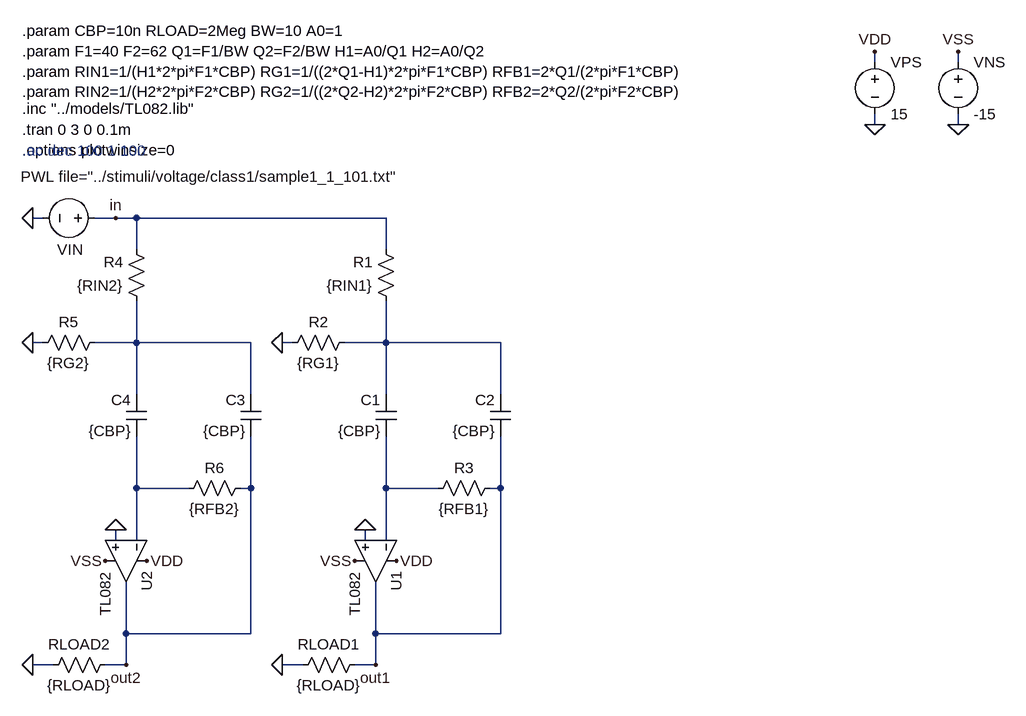
[diagram p0: schematic bpf2.asc]
bpf2.asc, the LTspice schematic file:
Version 4.1
SHEET 1 2028 1860
WIRE 688 -224 688 -240
WIRE 816 -224 816 -240
WIRE 688 -128 688 -144
WIRE 816 -128 816 -144
WIRE -592 16 -608 16
WIRE -480 16 -512 16
WIRE -448 16 -480 16
WIRE -64 16 -448 16
WIRE -448 64 -448 16
WIRE -64 64 -64 16
WIRE -592 208 -608 208
WIRE -448 208 -448 144
WIRE -448 208 -512 208
WIRE -272 208 -448 208
WIRE -208 208 -224 208
WIRE -64 208 -64 144
WIRE -64 208 -128 208
WIRE 112 208 -64 208
WIRE -448 288 -448 208
WIRE -272 288 -272 208
WIRE -64 288 -64 208
WIRE 112 288 112 208
WIRE -448 432 -448 352
WIRE -368 432 -448 432
WIRE -272 432 -272 352
WIRE -272 432 -288 432
WIRE -64 432 -64 352
WIRE 16 432 -64 432
WIRE 112 432 112 352
WIRE 112 432 96 432
WIRE -480 512 -480 496
WIRE -448 512 -448 432
WIRE -96 512 -96 496
WIRE -64 512 -64 432
WIRE -464 656 -464 576
WIRE -272 656 -272 432
WIRE -272 656 -464 656
WIRE -80 656 -80 576
WIRE 112 656 112 432
WIRE 112 656 -80 656
WIRE -576 704 -608 704
WIRE -464 704 -464 656
WIRE -464 704 -496 704
WIRE -192 704 -224 704
WIRE -80 704 -80 656
WIRE -80 704 -112 704
FLAG -608 16 0
FLAG -224 208 0
FLAG -96 496 0
FLAG -224 704 0
FLAG -48 544 VDD
FLAG -112 544 VSS
FLAG -480 16 in
FLAG -80 704 out1
FLAG 688 -128 0
FLAG 816 -128 0
FLAG 688 -240 VDD
FLAG 816 -240 VSS
FLAG -608 208 0
FLAG -480 496 0
FLAG -608 704 0
FLAG -432 544 VDD
FLAG -496 544 VSS
FLAG -464 704 out2
SYMBOL voltage -496 16 R90
WINDOW 123 -36 130 VLeft 2
WINDOW 39 0 0 Left 0
WINDOW 3 -64 130 VLeft 2
WINDOW 0 49 34 VRight 2
SYMATTR Value PWL file="../stimuli/voltage/class1/sample1_1_101.txt"
SYMATTR InstName VIN
SYMBOL res -48 160 R180
WINDOW 0 36 76 Left 2
WINDOW 3 36 40 Left 2
SYMATTR InstName R1
SYMATTR Value {RIN1}
SYMBOL res -112 192 R90
WINDOW 0 0 56 VBottom 2
WINDOW 3 32 56 VTop 2
SYMATTR InstName R2
SYMATTR Value {RG1}
SYMBOL cap 128 352 R180
WINDOW 0 24 56 Left 2
WINDOW 3 24 8 Left 2
SYMATTR InstName C2
SYMATTR Value {CBP}
SYMBOL cap -48 352 R180
WINDOW 0 24 56 Left 2
WINDOW 3 24 8 Left 2
SYMATTR InstName C1
SYMATTR Value {CBP}
SYMBOL res 112 416 R90
WINDOW 0 0 56 VBottom 2
WINDOW 3 32 56 VTop 2
SYMATTR InstName R3
SYMATTR Value {RFB1}
SYMBOL res -96 688 R90
WINDOW 0 0 56 VBottom 2
WINDOW 3 32 56 VTop 2
SYMATTR InstName RLOAD1
SYMATTR Value {RLOAD}
SYMBOL OpAmps\\opamp2 -16 544 R90
SYMATTR InstName U1
SYMATTR Value TL082
SYMBOL voltage 688 -240 R0
WINDOW 123 0 0 Left 0
WINDOW 39 0 0 Left 0
SYMATTR InstName VPS
SYMATTR Value 15
SYMBOL voltage 816 -240 R0
WINDOW 123 0 0 Left 0
WINDOW 39 0 0 Left 0
SYMATTR InstName VNS
SYMATTR Value -15
SYMBOL res -432 160 R180
WINDOW 0 36 76 Left 2
WINDOW 3 36 40 Left 2
SYMATTR InstName R4
SYMATTR Value {RIN2}
SYMBOL res -496 192 R90
WINDOW 0 0 56 VBottom 2
WINDOW 3 32 56 VTop 2
SYMATTR InstName R5
SYMATTR Value {RG2}
SYMBOL cap -256 352 R180
WINDOW 0 24 56 Left 2
WINDOW 3 24 8 Left 2
SYMATTR InstName C3
SYMATTR Value {CBP}
SYMBOL cap -432 352 R180
WINDOW 0 24 56 Left 2
WINDOW 3 24 8 Left 2
SYMATTR InstName C4
SYMATTR Value {CBP}
SYMBOL res -272 416 R90
WINDOW 0 0 56 VBottom 2
WINDOW 3 32 56 VTop 2
SYMATTR InstName R6
SYMATTR Value {RFB2}
SYMBOL res -480 688 R90
WINDOW 0 0 56 VBottom 2
WINDOW 3 32 56 VTop 2
SYMATTR InstName RLOAD2
SYMATTR Value {RLOAD}
SYMBOL OpAmps\\opamp2 -400 544 R90
SYMATTR InstName U2
SYMATTR Value TL082
TEXT -624 -272 Left 2 !.param CBP=10n RLOAD=2Meg BW=10 A0=1\n.param F1=40 F2=62 Q1=F1/BW Q2=F2/BW H1=A0/Q1 H2=A0/Q2\n.param RIN1=1/(H1*2*pi*F1*CBP) RG1=1/((2*Q1-H1)*2*pi*F1*CBP) RFB1=2*Q1/(2*pi*F1*CBP)\n.param RIN2=1/(H2*2*pi*F2*CBP) RG2=1/((2*Q2-H2)*2*pi*F2*CBP) RFB2=2*Q2/(2*pi*F2*CBP)
TEXT -624 -152 Left 2 !.inc "../models/TL082.lib"
TEXT -624 -120 Left 2 !.tran 0 3 0 0.1m\n.options plotwinsize=0
TEXT -624 -88 Left 2 ;.ac dec 100 1 100

The netlist it stands for:
* bpf2.asc
VIN in 0 PWL file="../stimuli/voltage/class1/sample1_1_101.txt"
R1 N002 in {RIN1}
R2 N002 0 {RG1}
C2 out1 N002 {CBP}
C1 N004 N002 {CBP}
R3 out1 N004 {RFB1}
RLOAD1 out1 0 {RLOAD}
X§U1 0 N004 VDD VSS out1 TL082  ; pins In+ In- V+ V- OUT
VPS VDD 0 15
VNS VSS 0 -15
R4 N001 in {RIN2}
R5 N001 0 {RG2}
C3 out2 N001 {CBP}
C4 N003 N001 {CBP}
R6 out2 N003 {RFB2}
RLOAD2 out2 0 {RLOAD}
X§U2 0 N003 VDD VSS out2 TL082  ; pins In+ In- V+ V- OUT
.param CBP=10n RLOAD=2Meg BW=10 A0=1
.param F1=40 F2=62 Q1=F1/BW Q2=F2/BW H1=A0/Q1 H2=A0/Q2
.param RIN1=1/(H1*2*pi*F1*CBP) RG1=1/((2*Q1-H1)*2*pi*F1*CBP) RFB1=2*Q1/(2*pi*F1*CBP)
.param RIN2=1/(H2*2*pi*F2*CBP) RG2=1/((2*Q2-H2)*2*pi*F2*CBP) RFB2=2*Q2/(2*pi*F2*CBP)
.inc "../models/TL082.lib"
.tran 0 3 0 0.1m
.options plotwinsize=0
* .ac dec 100 1 100
.backanno
.end